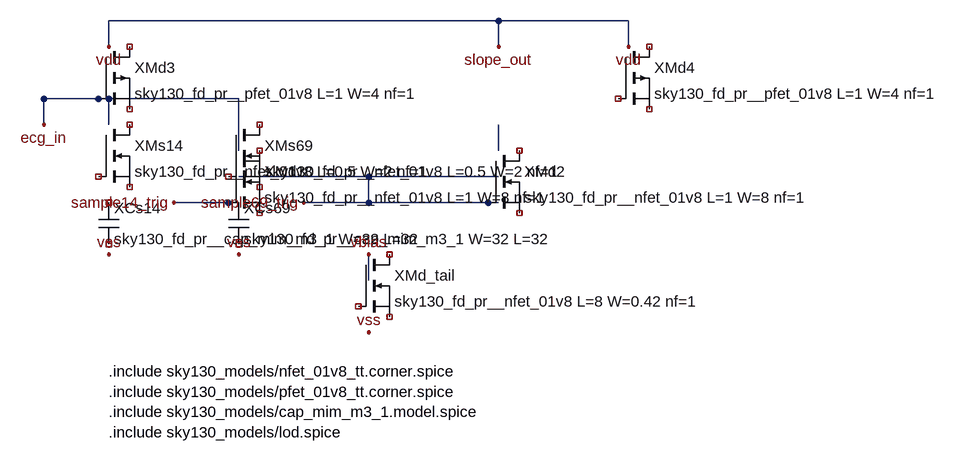
[diagram p0: schematic qrs_slope_schematic_F7.asc]
qrs_slope_schematic_F7.asc, the LTspice schematic file:
Version 4.1
SHEET 1 1200 800
WIRE -400 -200 -400 -240
WIRE -400 -240 400 -240
WIRE 400 -240 400 -200
WIRE 200 -200 200 -240
WIRE -400 -80 -400 -120
WIRE -400 -120 -500 -120
WIRE -200 -80 -200 -120
WIRE -200 -120 -500 -120
WIRE -500 -120 -500 -80
WIRE -200 0 0 0
WIRE 200 0 0 0
WIRE 0 0 0 40
WIRE 0 120 0 160
WIRE -200 -40 -200 -80
WIRE 200 -40 200 -80
WIRE -300 40 -200 40
WIRE -100 40 200 40
FLAG -500 -80 ecg_in
FLAG -400 -200 vdd
FLAG 400 -200 vdd
FLAG 200 -200 slope_out
FLAG -300 40 sample14_trig
FLAG -100 40 sample69_trig
FLAG 0 240 vss
FLAG -400 120 vss
FLAG -200 120 vss
FLAG 0 120 vbias
SYMBOL nmos -416 -80 R0
SYMATTR InstName XMs14
SYMATTR Value sky130_fd_pr__nfet_01v8 L=0.5 W=2 nf=1
SYMBOL cap -416 40 R0
SYMATTR InstName XCs14
SYMATTR Value sky130_fd_pr__cap_mim_m3_1 W=32 L=32
SYMBOL nmos -216 -80 R0
SYMATTR InstName XMs69
SYMATTR Value sky130_fd_pr__nfet_01v8 L=0.5 W=2 nf=1
SYMBOL cap -216 40 R0
SYMATTR InstName XCs69
SYMATTR Value sky130_fd_pr__cap_mim_m3_1 W=32 L=32
SYMBOL pmos -416 -200 R0
SYMATTR InstName XMd3
SYMATTR Value sky130_fd_pr__pfet_01v8 L=1 W=4 nf=1
SYMBOL pmos 384 -200 R0
SYMATTR InstName XMd4
SYMATTR Value sky130_fd_pr__pfet_01v8 L=1 W=4 nf=1
SYMBOL nmos -216 -40 R0
SYMATTR InstName XMd1
SYMATTR Value sky130_fd_pr__nfet_01v8 L=1 W=8 nf=1
SYMBOL nmos 184 -40 R0
SYMATTR InstName XMd2
SYMATTR Value sky130_fd_pr__nfet_01v8 L=1 W=8 nf=1
SYMBOL nmos -16 120 R0
SYMATTR InstName XMd_tail
SYMATTR Value sky130_fd_pr__nfet_01v8 L=8 W=0.42 nf=1
TEXT -400 300 Left 2 !.include sky130_models/nfet_01v8_tt.corner.spice\n.include sky130_models/pfet_01v8_tt.corner.spice\n.include sky130_models/cap_mim_m3_1.model.spice\n.include sky130_models/lod.spice

The netlist it stands for:
* qrs_slope_schematic_F7.asc
* XMs14: sky130_fd_pr__nfet_01v8 L=0.5 W=2 nf=1 (symbol nmos not certain, pin order unknown); nets seen at it: 
C§XCs14 NC_04 NC_05 sky130_fd_pr__cap_mim_m3_1 W=32 L=32
* XMs69: sky130_fd_pr__nfet_01v8 L=0.5 W=2 nf=1 (symbol nmos not certain, pin order unknown); nets seen at it: 
C§XCs69 sample14_trig NC_09 sky130_fd_pr__cap_mim_m3_1 W=32 L=32
M§XMd3 NC_10 ecg_in NC_11 NC_11 sky130_fd_pr__pfet_01v8 L=1 W=4 nf=1
M§XMd4 NC_12 NC_13 NC_14 NC_14 sky130_fd_pr__pfet_01v8 L=1 W=4 nf=1
* XMd1: sky130_fd_pr__nfet_01v8 L=1 W=8 nf=1 (symbol nmos not certain, pin order unknown); nets seen at it: sample14_trig
* XMd2: sky130_fd_pr__nfet_01v8 L=1 W=8 nf=1 (symbol nmos not certain, pin order unknown); nets seen at it: sample69_trig
* XMd_tail: sky130_fd_pr__nfet_01v8 L=8 W=0.42 nf=1 (symbol nmos not certain, pin order unknown); nets seen at it: 
.model NMOS NMOS
.model PMOS PMOS
.lib standard.mos
.include sky130_models/nfet_01v8_tt.corner.spice
.include sky130_models/pfet_01v8_tt.corner.spice
.include sky130_models/cap_mim_m3_1.model.spice
.include sky130_models/lod.spice
.backanno
.end